# EAGLE design MODULE_TEST_ESPS3_V_1_1_1 (EAGLE 9.6.2)
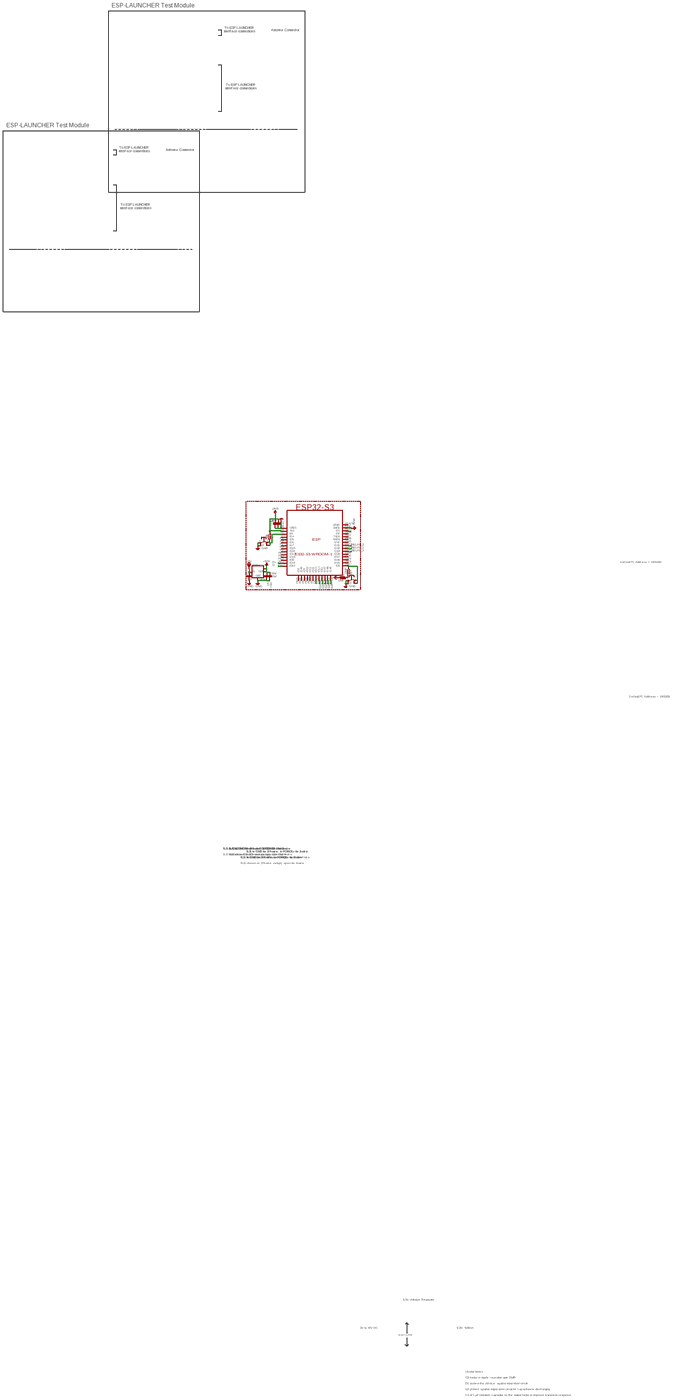
[diagram p0: schematic, sheet 1, overview]
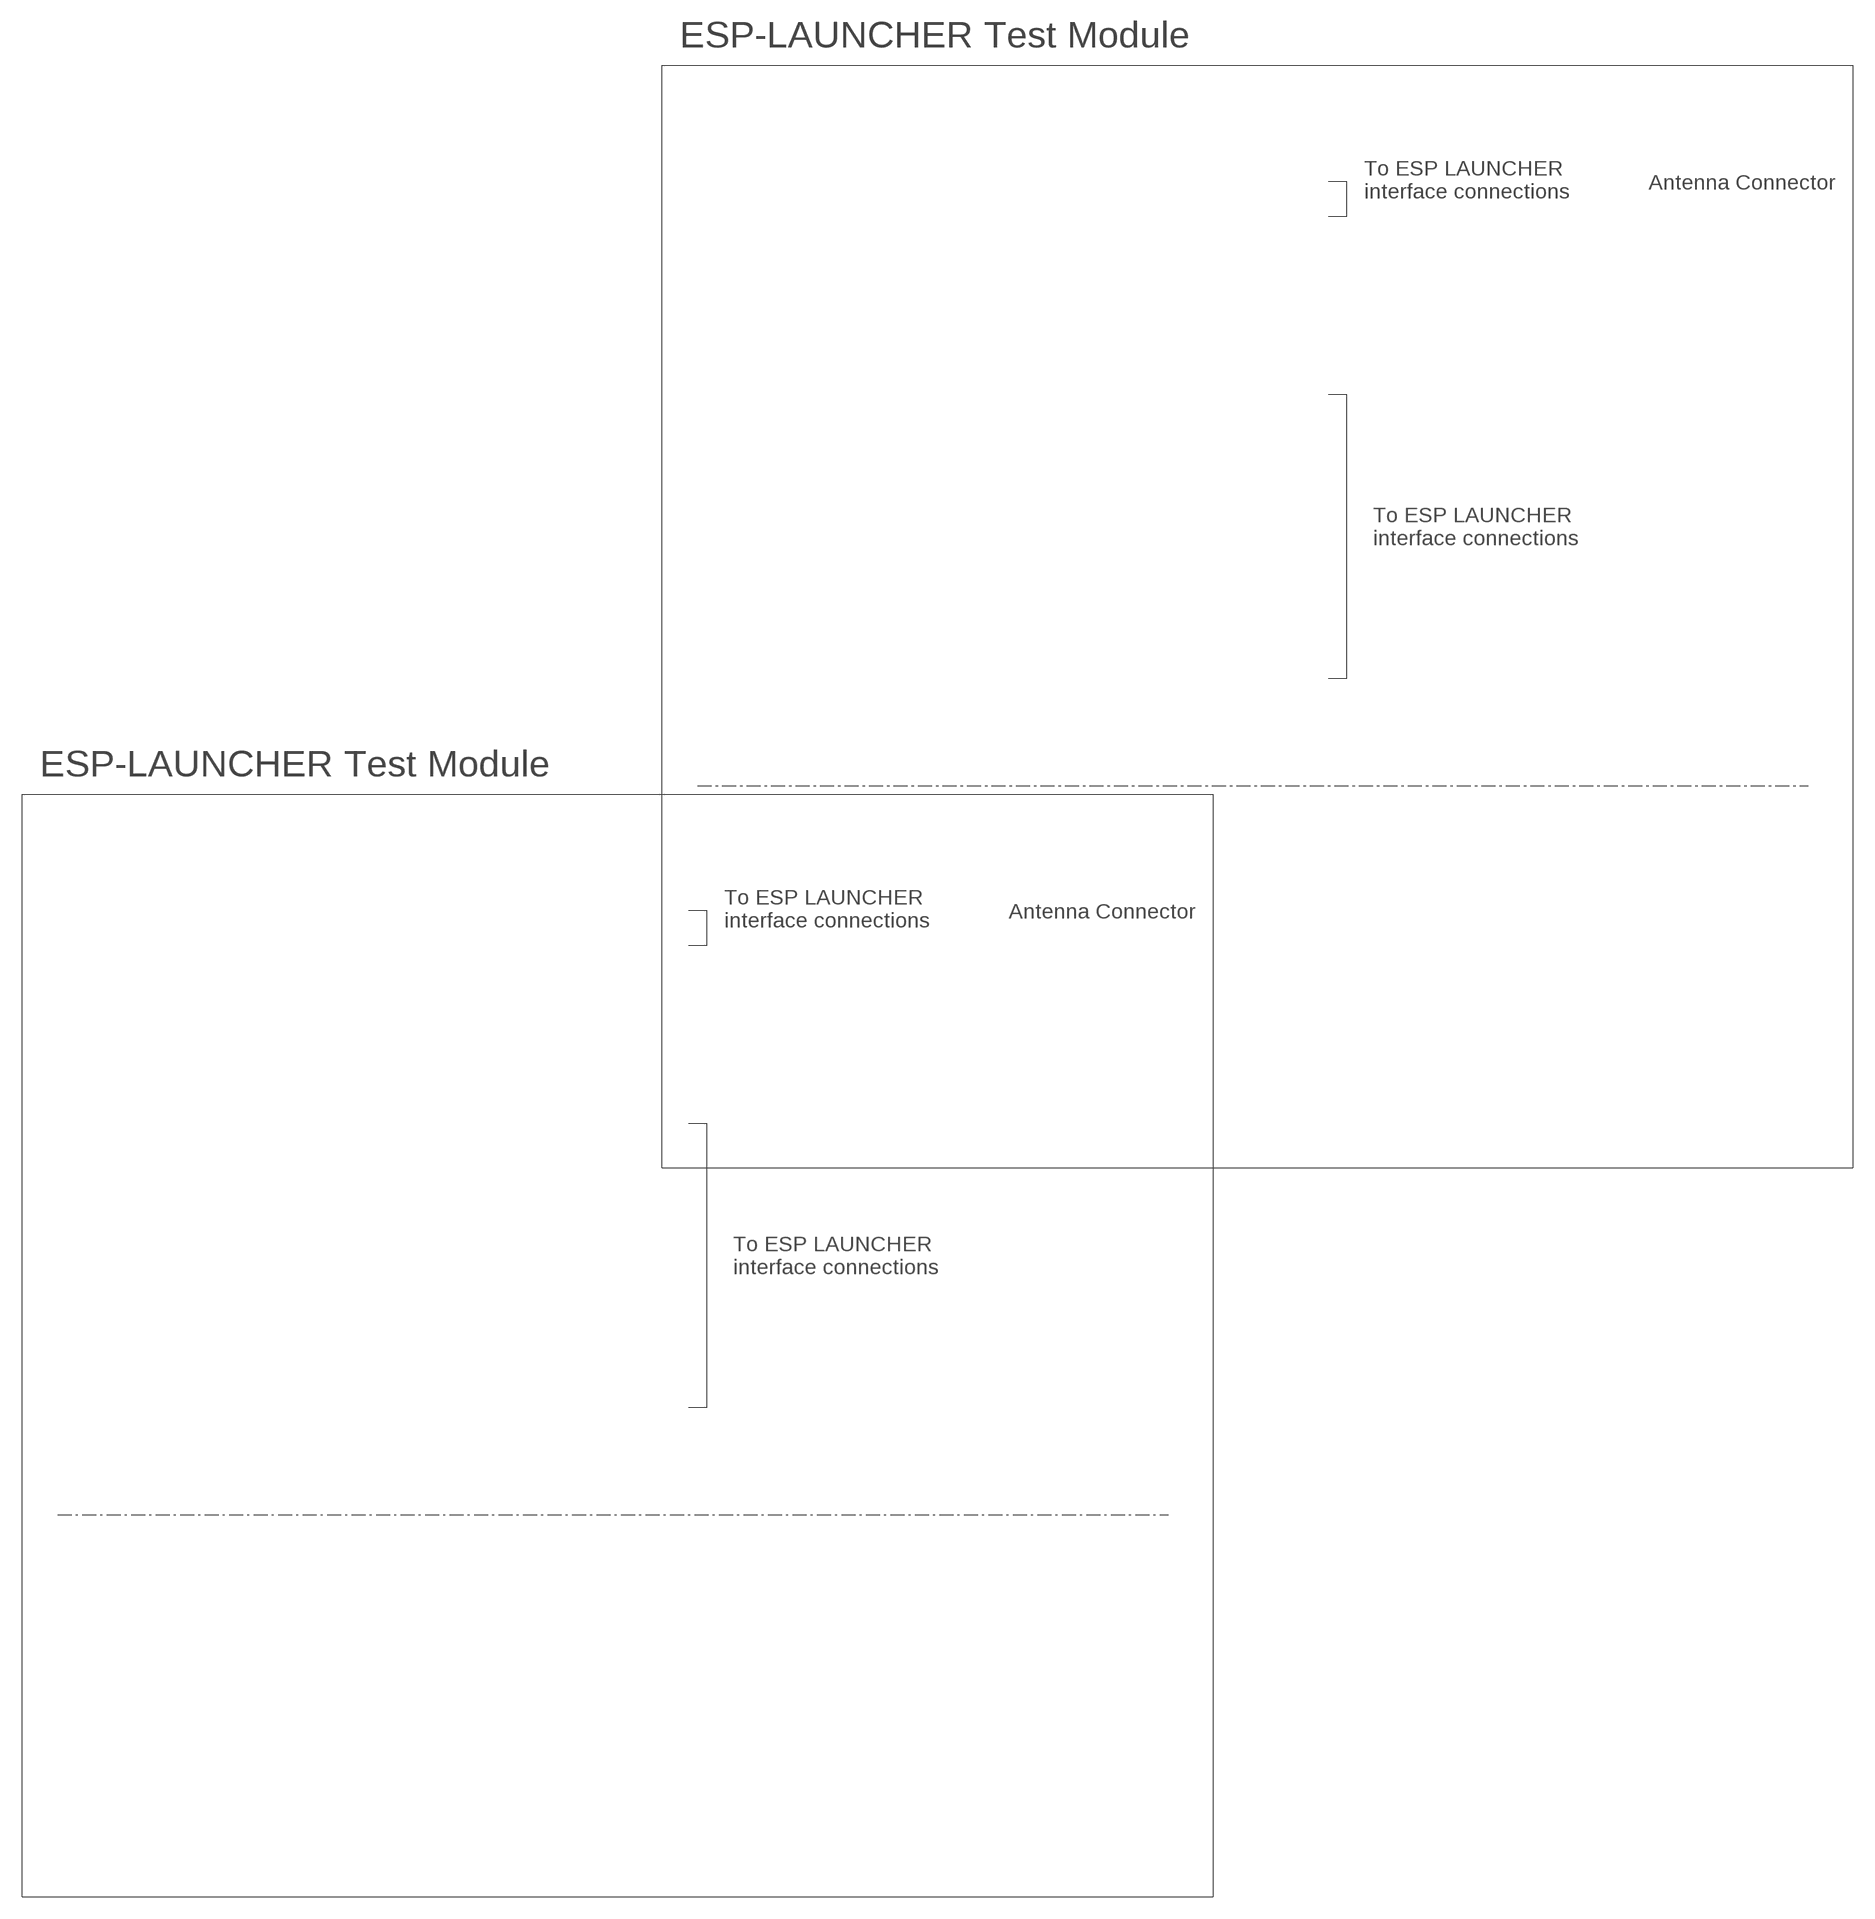
[diagram p1: schematic, sheet 1, part 1 of 4]
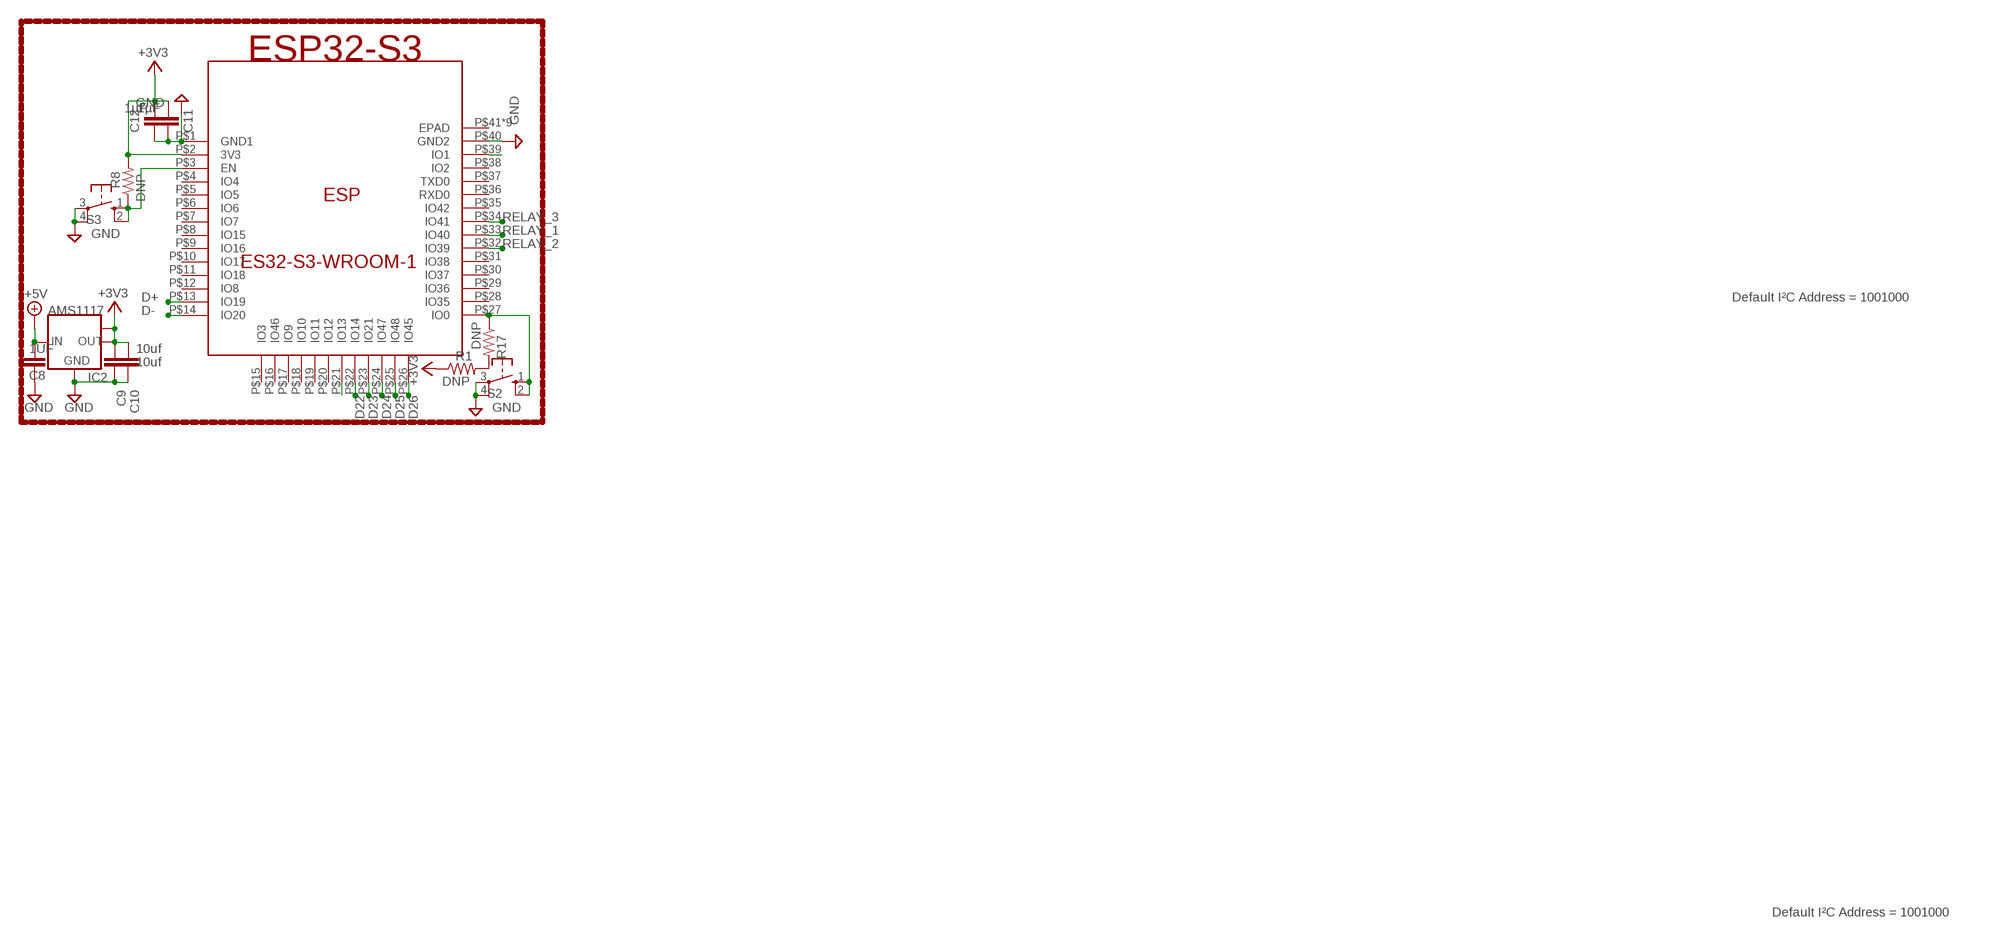
[diagram p2: schematic, sheet 1, part 2 of 4]
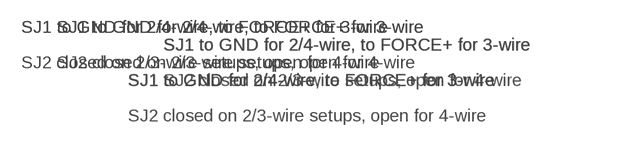
[diagram p3: schematic, sheet 1, part 3 of 4]
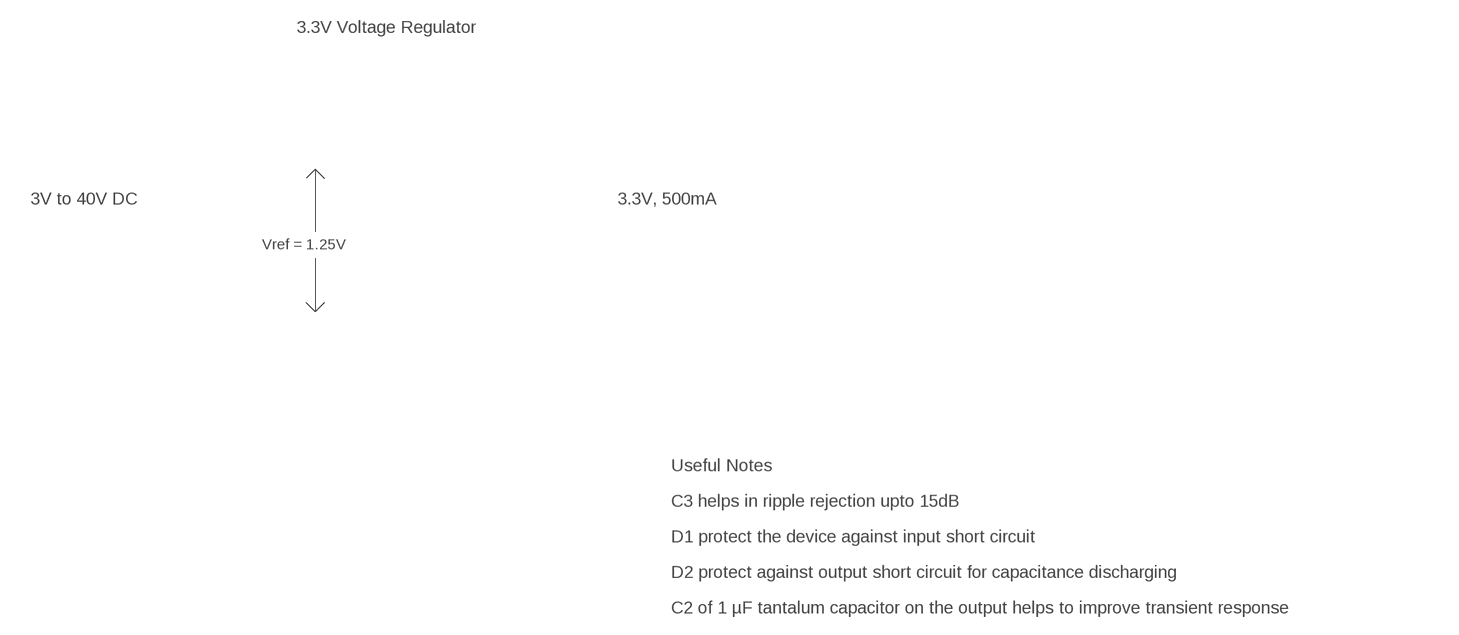
[diagram p4: schematic, sheet 1, part 4 of 4]

## Parts
C8  1UF  C-EUC1206K  [C1206K]
C9  10uf  C-EUC1206K  [C1206K]
C10  10uf  C-EUC1206K  [C1206K]
C11  1µF  C-EUC0805K  [C0805K]
C12  1µF  C-EUC0805K  [C0805K]
ESP  ES32-S3-WROOM-1  [ESP32-S3-WROOM-1]
IC2  AMS1117  LM1117MPX-5.0  [SOT223]
R1  DNP  R-US_VMTB60  [VMTB60]
R8  DNP  R-US_R0603  [R0603]
R17  DNP  R-US_R0805  [R0805]
S2  10-XX  [B3F-10XX]
S3  10-XX  [B3F-10XX]

## Nets
+3V3: C9.1 C10.1 C11.2 C12.2 ESP.P$2(3V3) IC2.2(OUT) IC2.TAB(OUT1) R1.1 R8.2
+5V: C8.1 IC2.3(IN)
D22: ESP.P$22(IO14)
D23: ESP.P$23(IO21)
D24: ESP.P$24(IO47)
D25: ESP.P$25(IO48)
D26: ESP.P$26(IO45)
D+: ESP.P$13(IO19)
D-: ESP.P$14(IO20)
GND: C8.2 C9.2 C10.2 C11.1 C12.1 ESP.P$1(GND1) ESP.P$40(GND2) IC2.1(GND) S2.3(P) S2.4(P1) S3.3(P) S3.4(P1)
N$3: ESP.P$39(IO1)
N$4: ESP.P$21(IO13)
N$15: ESP.P$3(EN) R8.1 S3.1(S) S3.2(S1)
N$29: ESP.P$27(IO0) R17.1 S2.1(S) S2.2(S1)
N$37: R1.2 R17.2
RELAY_1: ESP.P$33(IO40)
RELAY_2: ESP.P$32(IO39)
RELAY_3: ESP.P$34(IO41)
Unconnected: ESP.P$4(IO4) ESP.P$5(IO5) ESP.P$6(IO6) ESP.P$7(IO7) ESP.P$8(IO15) ESP.P$9(IO16) ESP.P$10(IO17) ESP.P$11(IO18) ESP.P$12(IO8) ESP.P$15(IO3) ESP.P$16(IO46) ESP.P$17(IO9) ESP.P$18(IO10) ESP.P$19(IO11) ESP.P$20(IO12) ESP.P$28(IO35) ESP.P$29(IO36) ESP.P$30(IO37) ESP.P$31(IO38) ESP.P$35(IO42) ESP.P$36(RXD0) ESP.P$37(TXD0) ESP.P$38(IO2) ESP.P$41(EPAD) ESP.P$42(EPAD) ESP.P$43(EPAD) ESP.P$44(EPAD) ESP.P$45(EPAD) ESP.P$46(EPAD) ESP.P$47(EPAD) ESP.P$48(EPAD) ESP.P$49(EPAD)

## Notes on the sheet
- ESP-LAUNCHER Test Module
- Antenna Connector
- To ESP LAUNCHER
  interface connections
- To ESP LAUNCHER
  interface connections
- ESP-LAUNCHER Test Module
- Antenna Connector
- To ESP LAUNCHER
  interface connections
- To ESP LAUNCHER
  interface connections
- Default I²C Address = 1001000
- Default I²C Address = 1001000
- SJ1 to GND for 2/4-wire, to FORCE+ for 3-wire | SJ1 to GND for 2/4-wire, to FORCE+ for 3-wire | SJ1 to GND for 2/4-wire, to FORCE+ for 3-wire | SJ1 to GND for 2/4-wire, to FORCE+ for 3-wire
- SJ1 to GND for 2/4-wire, to FORCE+ for 3-wire | SJ1 to GND for 2/4-wire, to FORCE+ for 3-wire
- SJ2 closed on 2/3-wire setups, open for 4-wire | SJ2 closed on 2/3-wire setups, open for 4-wire
- SJ1 to GND for 2/4-wire, to FORCE+ for 3-wire | SJ1 to GND for 2/4-wire, to FORCE+ for 3-wire | SJ2 closed on 2/3-wire setups, open for 4-wire
- SJ2 closed on 2/3-wire setups, open for 4-wire
- 3.3V Voltage Regulator
- 3V to 40V DC | 3.3V, 500mA
- Vref = 1.25V
- Useful Notes
- C3 helps in ripple rejection upto 15dB
- D1 protect the device against input short circuit
- D2 protect against output short circuit for capacitance discharging
- C2 of 1 µF tantalum capacitor on the output helps to improve transient response

## Library data of the parts
C8-C12 = rcl:C-EU: CAPACITOR, European symbol; SPICEPREFIX: C
ESP = ESP32 Module:ES32-S3-WROOM-1
IC2 = lm1117:LM1117MPX-*
R1 R8 R17 = rcl:R-US_: RESISTOR, American symbol; SPICEPREFIX: R
S2 S3 = switch-omron:10-XX: OMRON SWITCH; MPN: B3F-1000; OC_FARNELL: 176432; OC_NEWARK: 36M3542

## Module WAVESHAREDISPLAY
Ports: 

### Library data of the parts

## Board
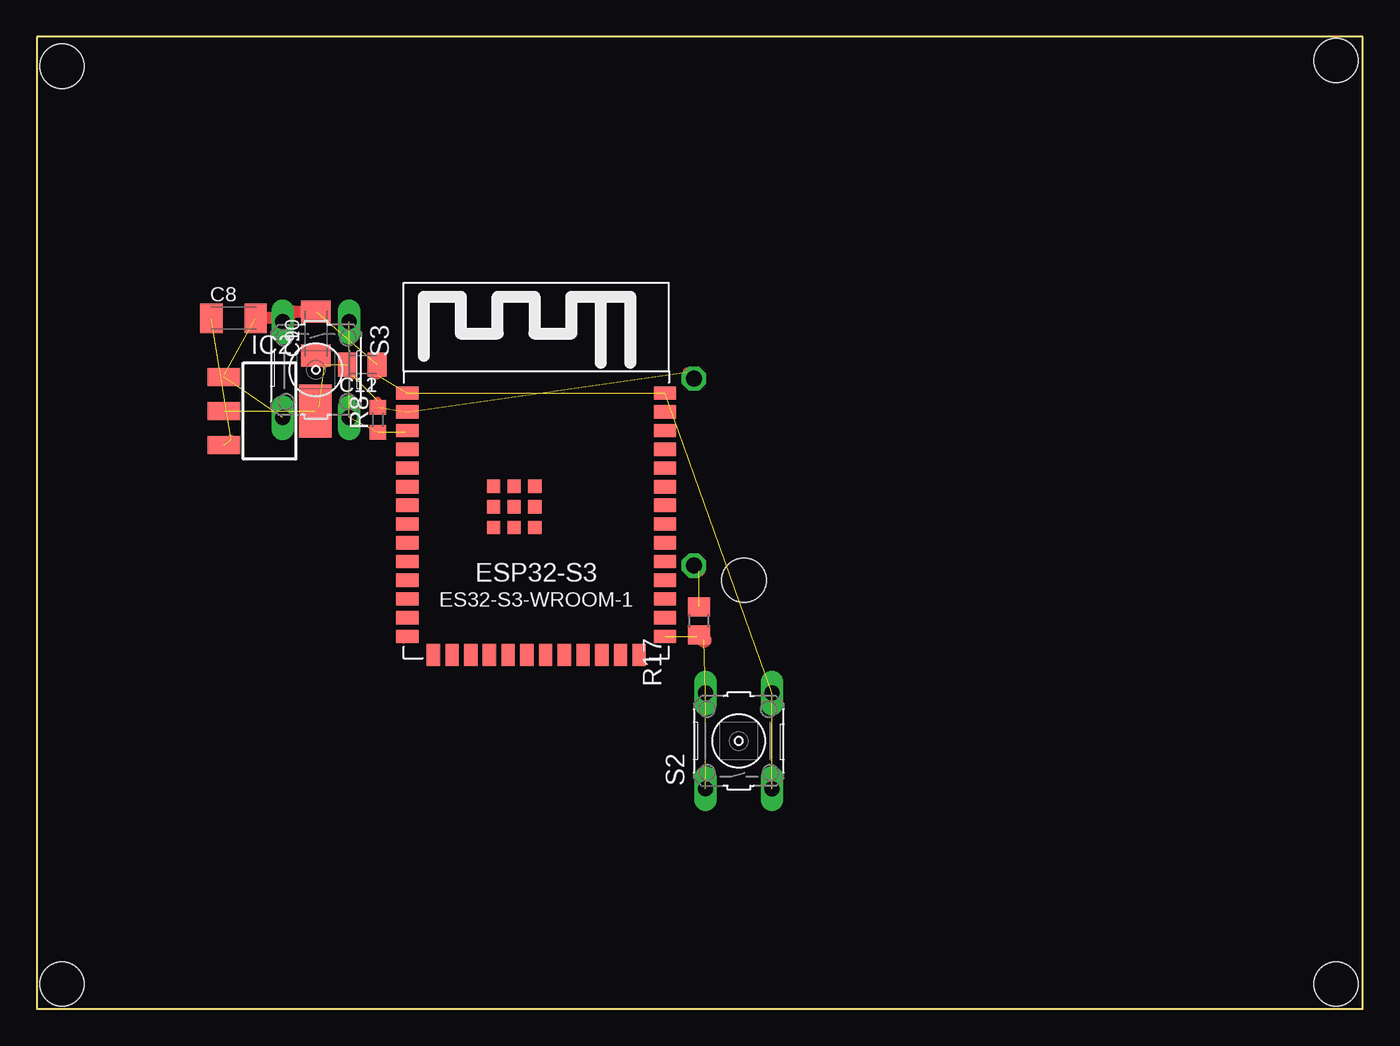
[diagram p5: board, top side]
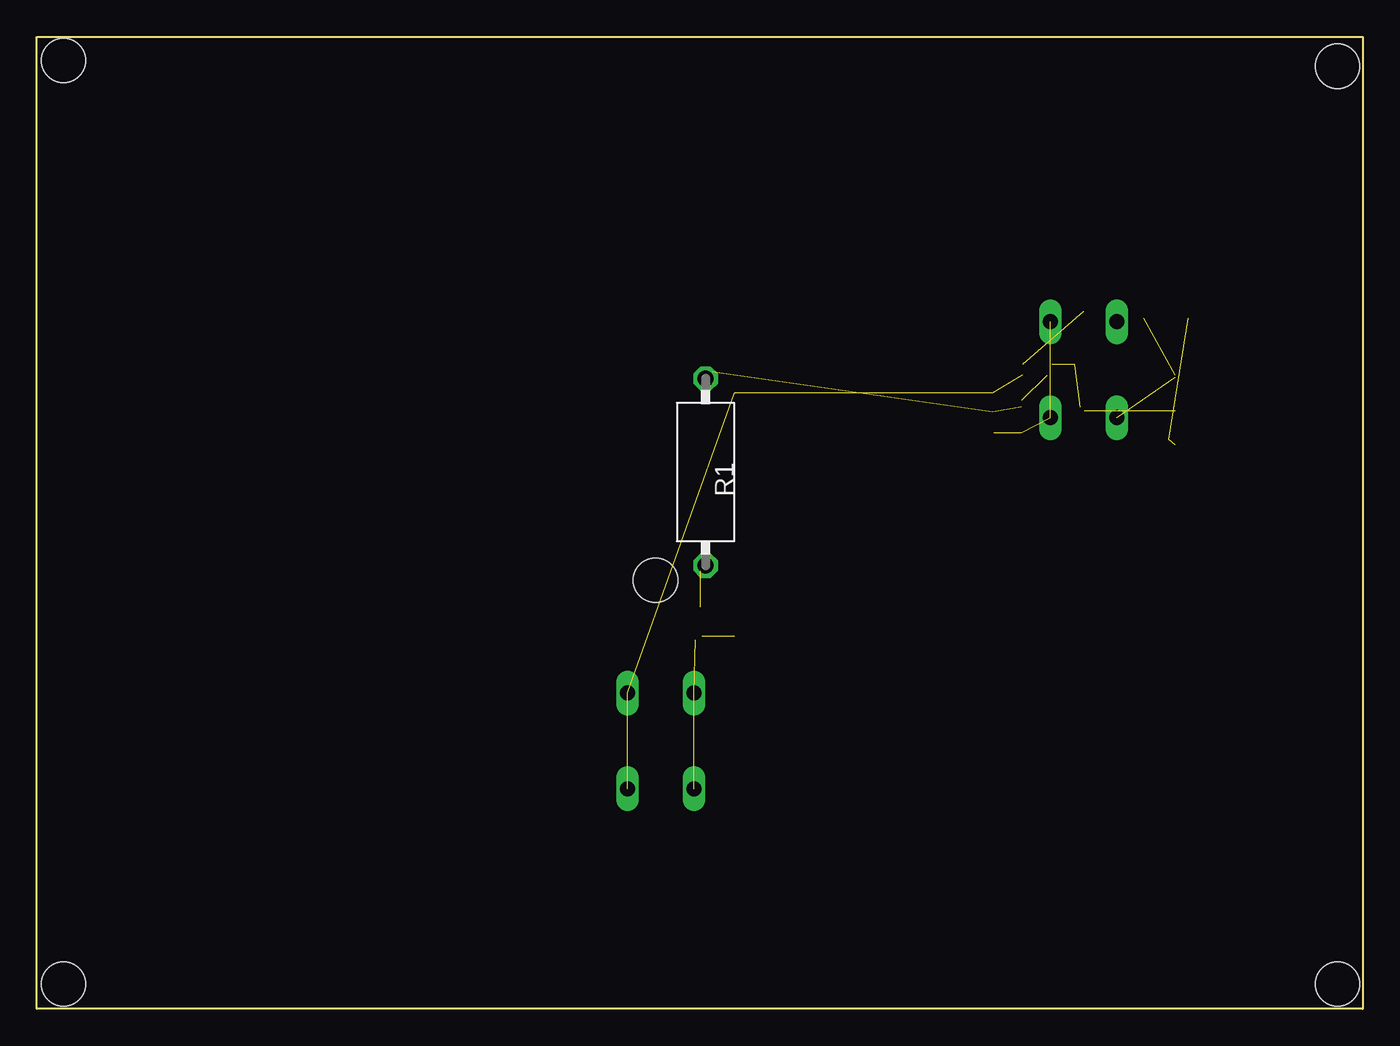
[diagram p6: board, bottom side, seen from below]

Size 90 x 66 mm. Coordinates in mm from the lower left corner, seen from the top.
Outline: 0,0 90,0 90,66 0,66 0,0
Copper layers (1*16): Top 0.035mm / dielectric 1.5mm / Bottom 0.035mm
Design rules "default": minimum track width 6mil, minimum drill 0.35mm, track to track 6mil, track to pad 6mil, pad to pad 6mil, via to via 6mil, smd to smd 6mil, copper to edge 40mil, drill to drill 6mil, minimum pad ring 10mil, minimum via ring 8mil, stop-mask expansion 4mil, vias tented up to drill 0mil, thermal gap 10mil
Holes 3 mm at 1.7,1.7 1.7,64 88.2,64.4 88.2,1.7 48,29.1

### Footprints (pad centres in the part's own frame; a part is rotated, then mirrored left to right if it is on the bottom)
C1206K = smd 1.5 x 2: 1 -1.5,0; 2 1.5,0
C0805K = smd 1.3 x 1.6: 1 -1,0; 2 1,0
ESP32-S3-WROOM-1 = smd 1.5 x 0.9: P$1 0.25,18.01; P$2 0.25,16.74; P$3 0.25,15.47; P$4 0.25,14.2; P$5 0.25,12.93; P$6 0.25,11.66; P$7 0.25,10.39; P$8 0.25,9.12; P$9 0.25,7.85; P$10 0.25,6.58; P$11 0.25,5.31; P$12 0.25,4.04; P$13 0.25,2.77; P$14 0.25,1.5; P$27 17.75,1.5; P$28 17.75,2.77; P$29 17.75,4.04; P$30 17.75,5.31; P$31 17.75,6.58; P$32 17.75,7.85; P$33 17.75,9.12; P$34 17.75,10.39; P$35 17.75,11.66; P$36 17.75,12.93; P$37 17.75,14.2; P$38 17.75,15.47; P$39 17.75,16.74; P$40 17.75,18.01 | smd 0.9 x 1.5: P$15 2.015,0.25; P$16 3.285,0.25; P$17 4.555,0.25; P$18 5.825,0.25; P$19 7.095,0.25; P$20 8.365,0.25; P$21 9.635,0.25; P$22 10.905,0.25; P$23 12.175,0.25; P$24 13.445,0.25; P$25 14.715,0.25; P$26 15.985,0.25 | smd 0.9 x 0.9: P$41 6.1,11.69; P$42 7.5,11.69; P$43 8.9,11.69; P$44 6.1,10.29; P$45 7.5,10.29; P$46 8.9,10.29; P$47 6.1,8.89; P$48 7.5,8.89; P$49 8.9,8.89
SOT223 = smd 1.219 x 2.235: 1 -2.311,-3.099; 2 0,-3.099; 3 2.311,-3.099 | smd 3.6 x 2.2: TAB 0,3.099
VMTB60 = drill 1.1 octagon: 1 -6.35,0; 2 6.35,0
R0603 = smd 1 x 1.1: 1 -0.85,0; 2 0.85,0
R0805 = smd 1.3 x 1.5: 1 -0.95,0; 2 0.95,0
B3F-10XX = drill 1.016 long: 1 -3.251,2.261; 2 3.251,2.261; 3 -3.251,-2.261; 4 3.251,-2.261

### Placement (x,y rotation side)
C8  13.35,46.9 0 top
C9  18.95,45.85 90 top
C10  18.95,45.85 90 top
C11  22.1,43.75 180 top
C12  22.1,43.75 180 top
ESP  24.9,23.8 0 top
IC2  15.8,40.6 270 top
R1  44.6,36.45 270 bottom
R8  23.15,40 90 top
R17  44.95,26.35 90 top
S2  47.65,18.2 90 top
S3  18.95,43.4 270 top

### Tracks (layer width: path | path; a pad name or v marks a point on that pad's centre or on a via)
+3V3  (6 unrouted)
  Top 0.508: R8.2 23.15,41.3 | C11.2 21.45,43.4 21.45,43 | C10.1 19.55,43.75 | IC2.TAB 18.9,39.6 18.95,39.55
  Top 0.61: 18.95,40.6 IC2.TAB 19.15,40.85 | R1.1 44.15,43.25
+5V  (2 unrouted)
  Top 0.61: 12.56,38.15 IC2.3 12.39,37.98 | 13.18,38.67 13.35,38.5
D22
  Top 0.61: 35.75,24 ESP.P$22
D-
  Top 0.508: ESP.P$14 24.9,25.05
GND  (7 unrouted)
  Top 0.61: 23.1,43.05 C11.1 23.25,43.9 | IC2.1 12.7,43.05
  Top 0.813: C8.2 16.44,46.9 S3.3 17.39,47.35 C10.2
N$4
  Top 0.61: ESP.P$21 34.55,24.04
N$15  (3 unrouted)
  Top 0.61: ESP.P$3 25.03,39.15
N$29  (3 unrouted)
  Top 0.61: 44.85,25.3 R17.1
  Top 1.016: R17.1 45.3,25.05
N$37  (1 unrouted)
  Top 0.813: R1.2 44.95,29.75